# EAGLE schematic ecad-flight-controller-v4-ascend-flight-controllerv4-sch (EAGLE 9.7.0)
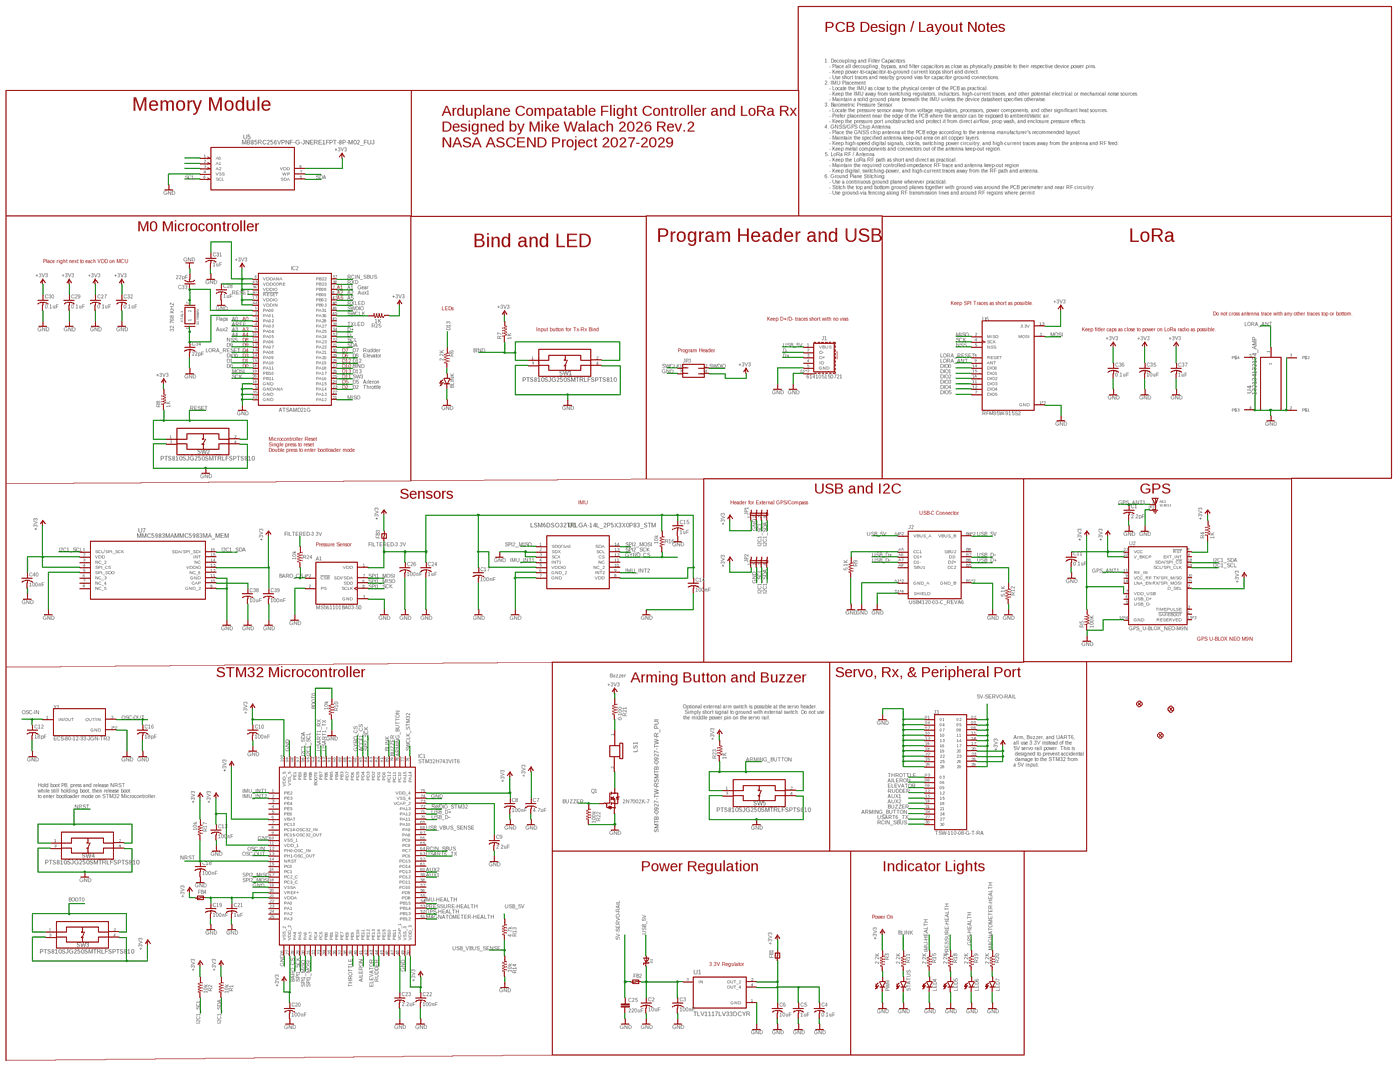
[diagram p0: schematic, sheet 1, overview]
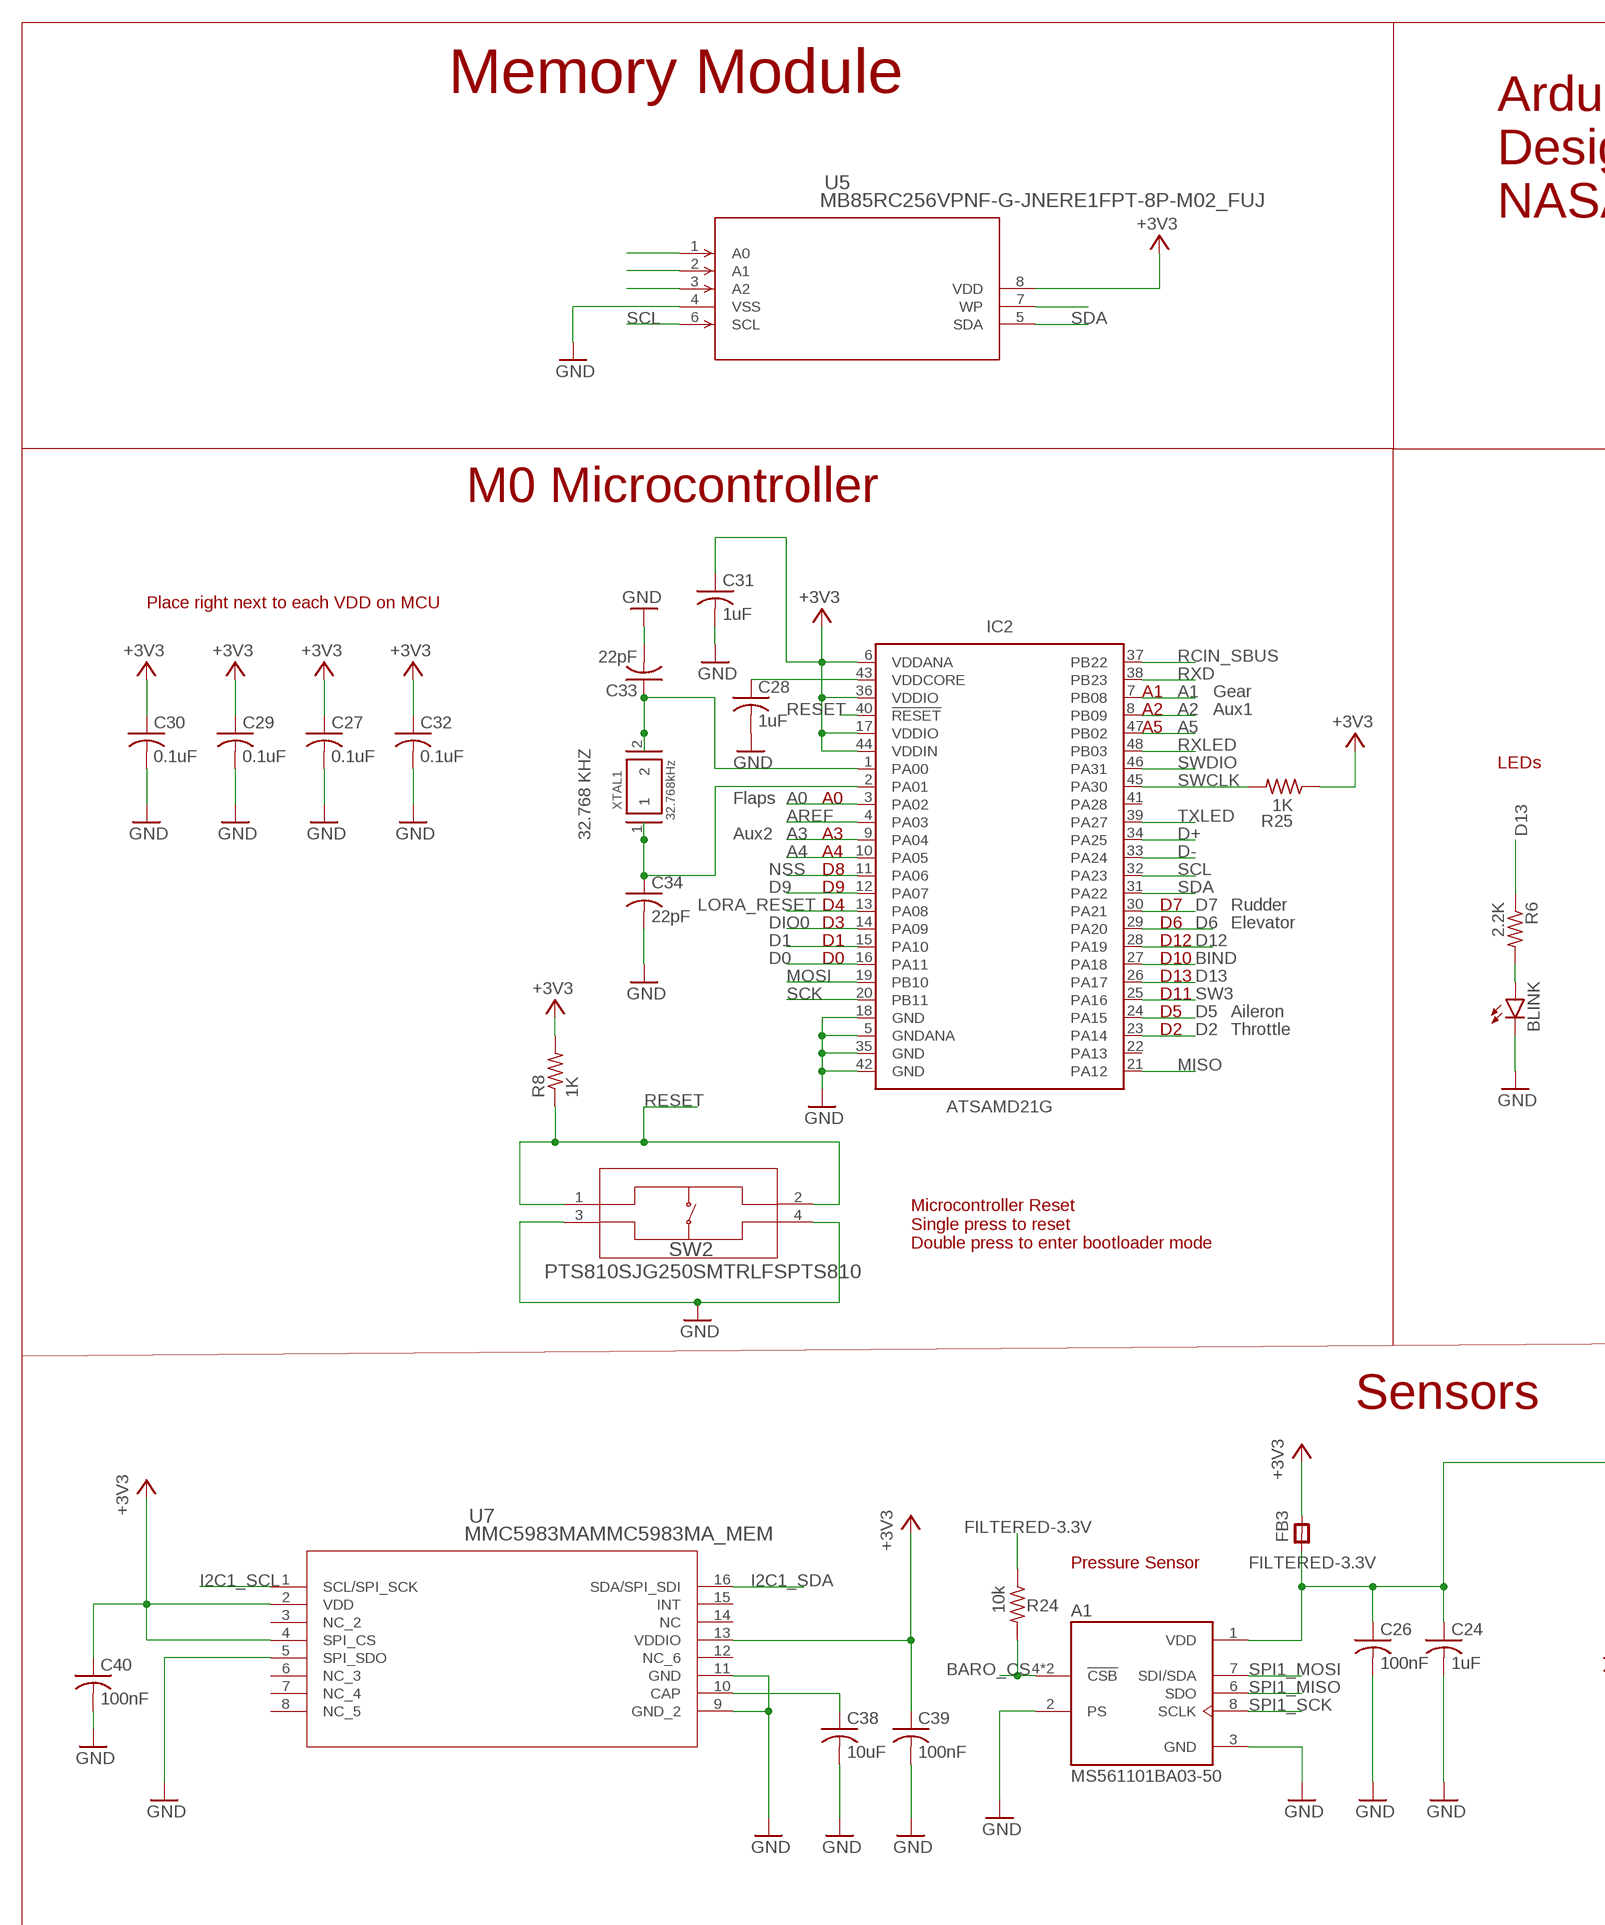
[diagram p1: schematic, sheet 1, part 1 of 4]
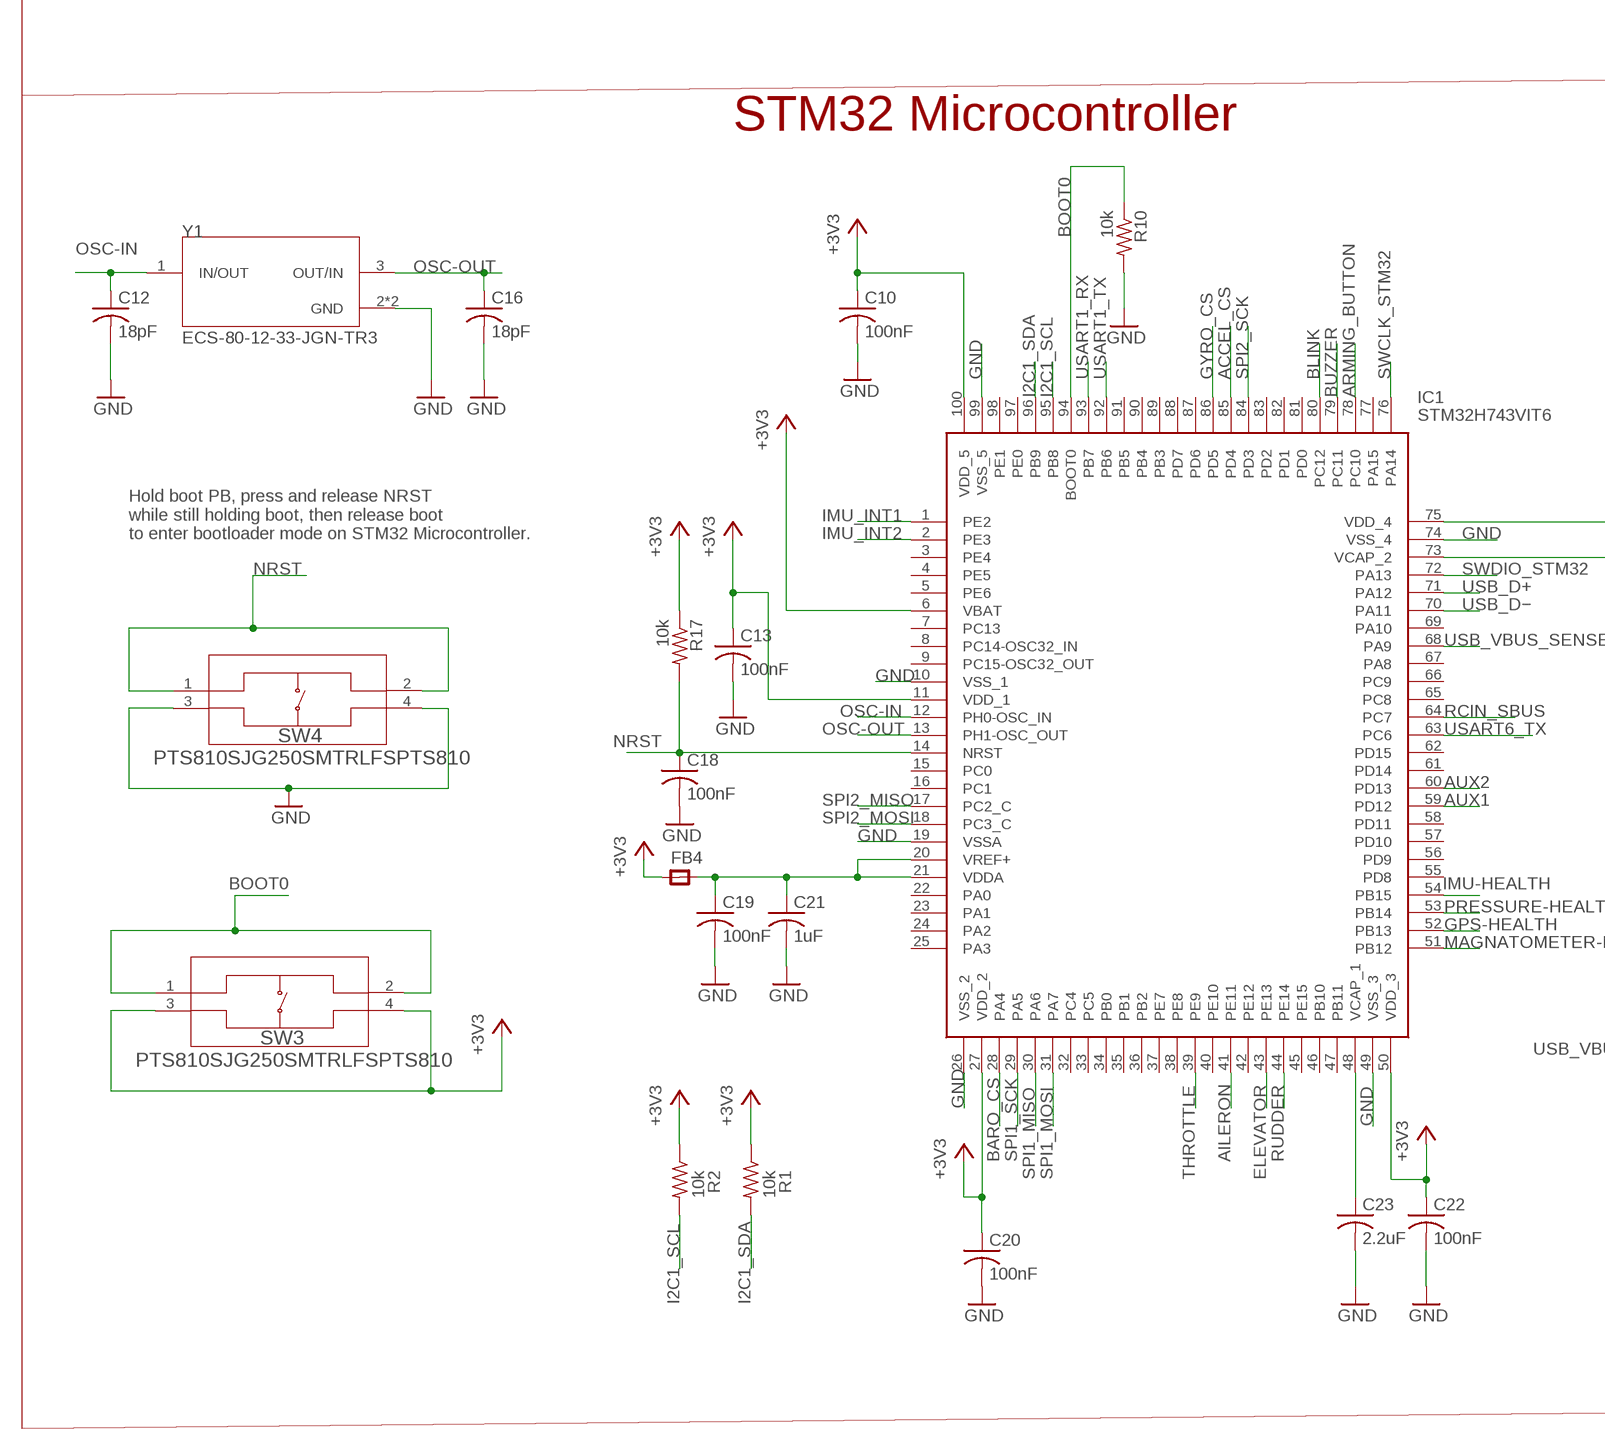
[diagram p2: schematic, sheet 1, part 2 of 4]
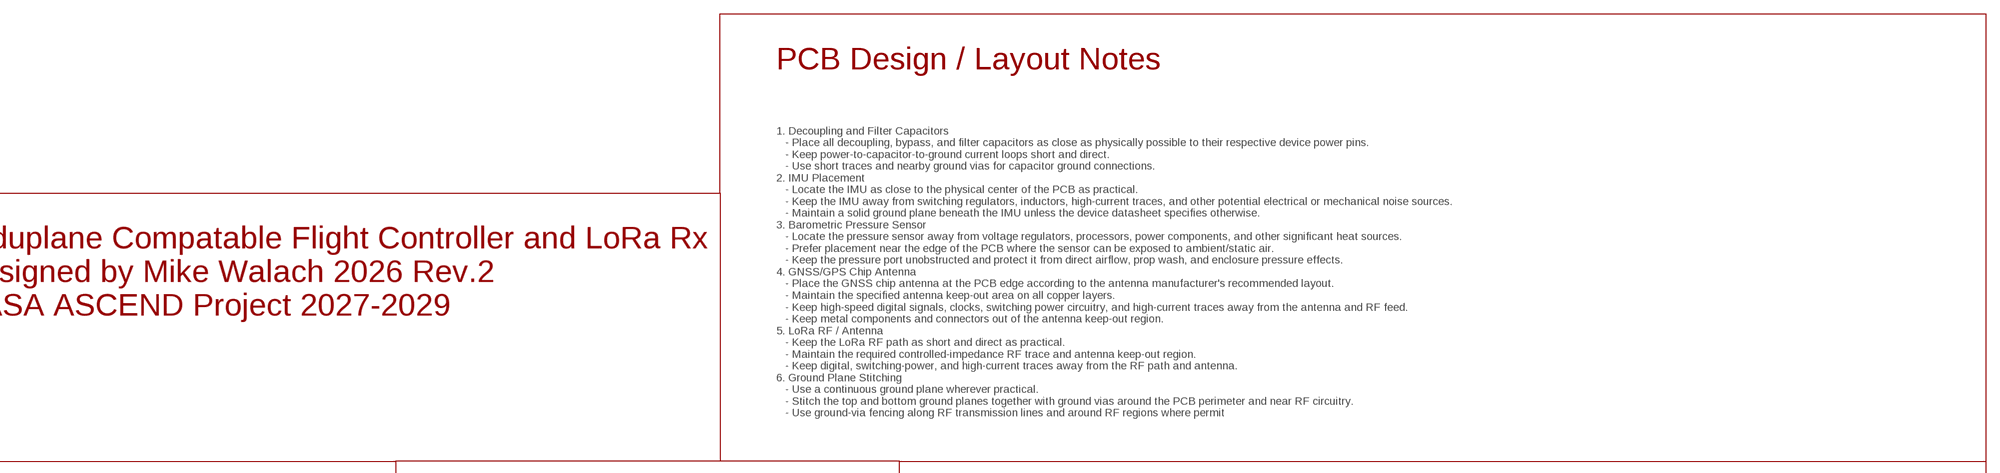
[diagram p3: schematic, sheet 1, part 3 of 4]
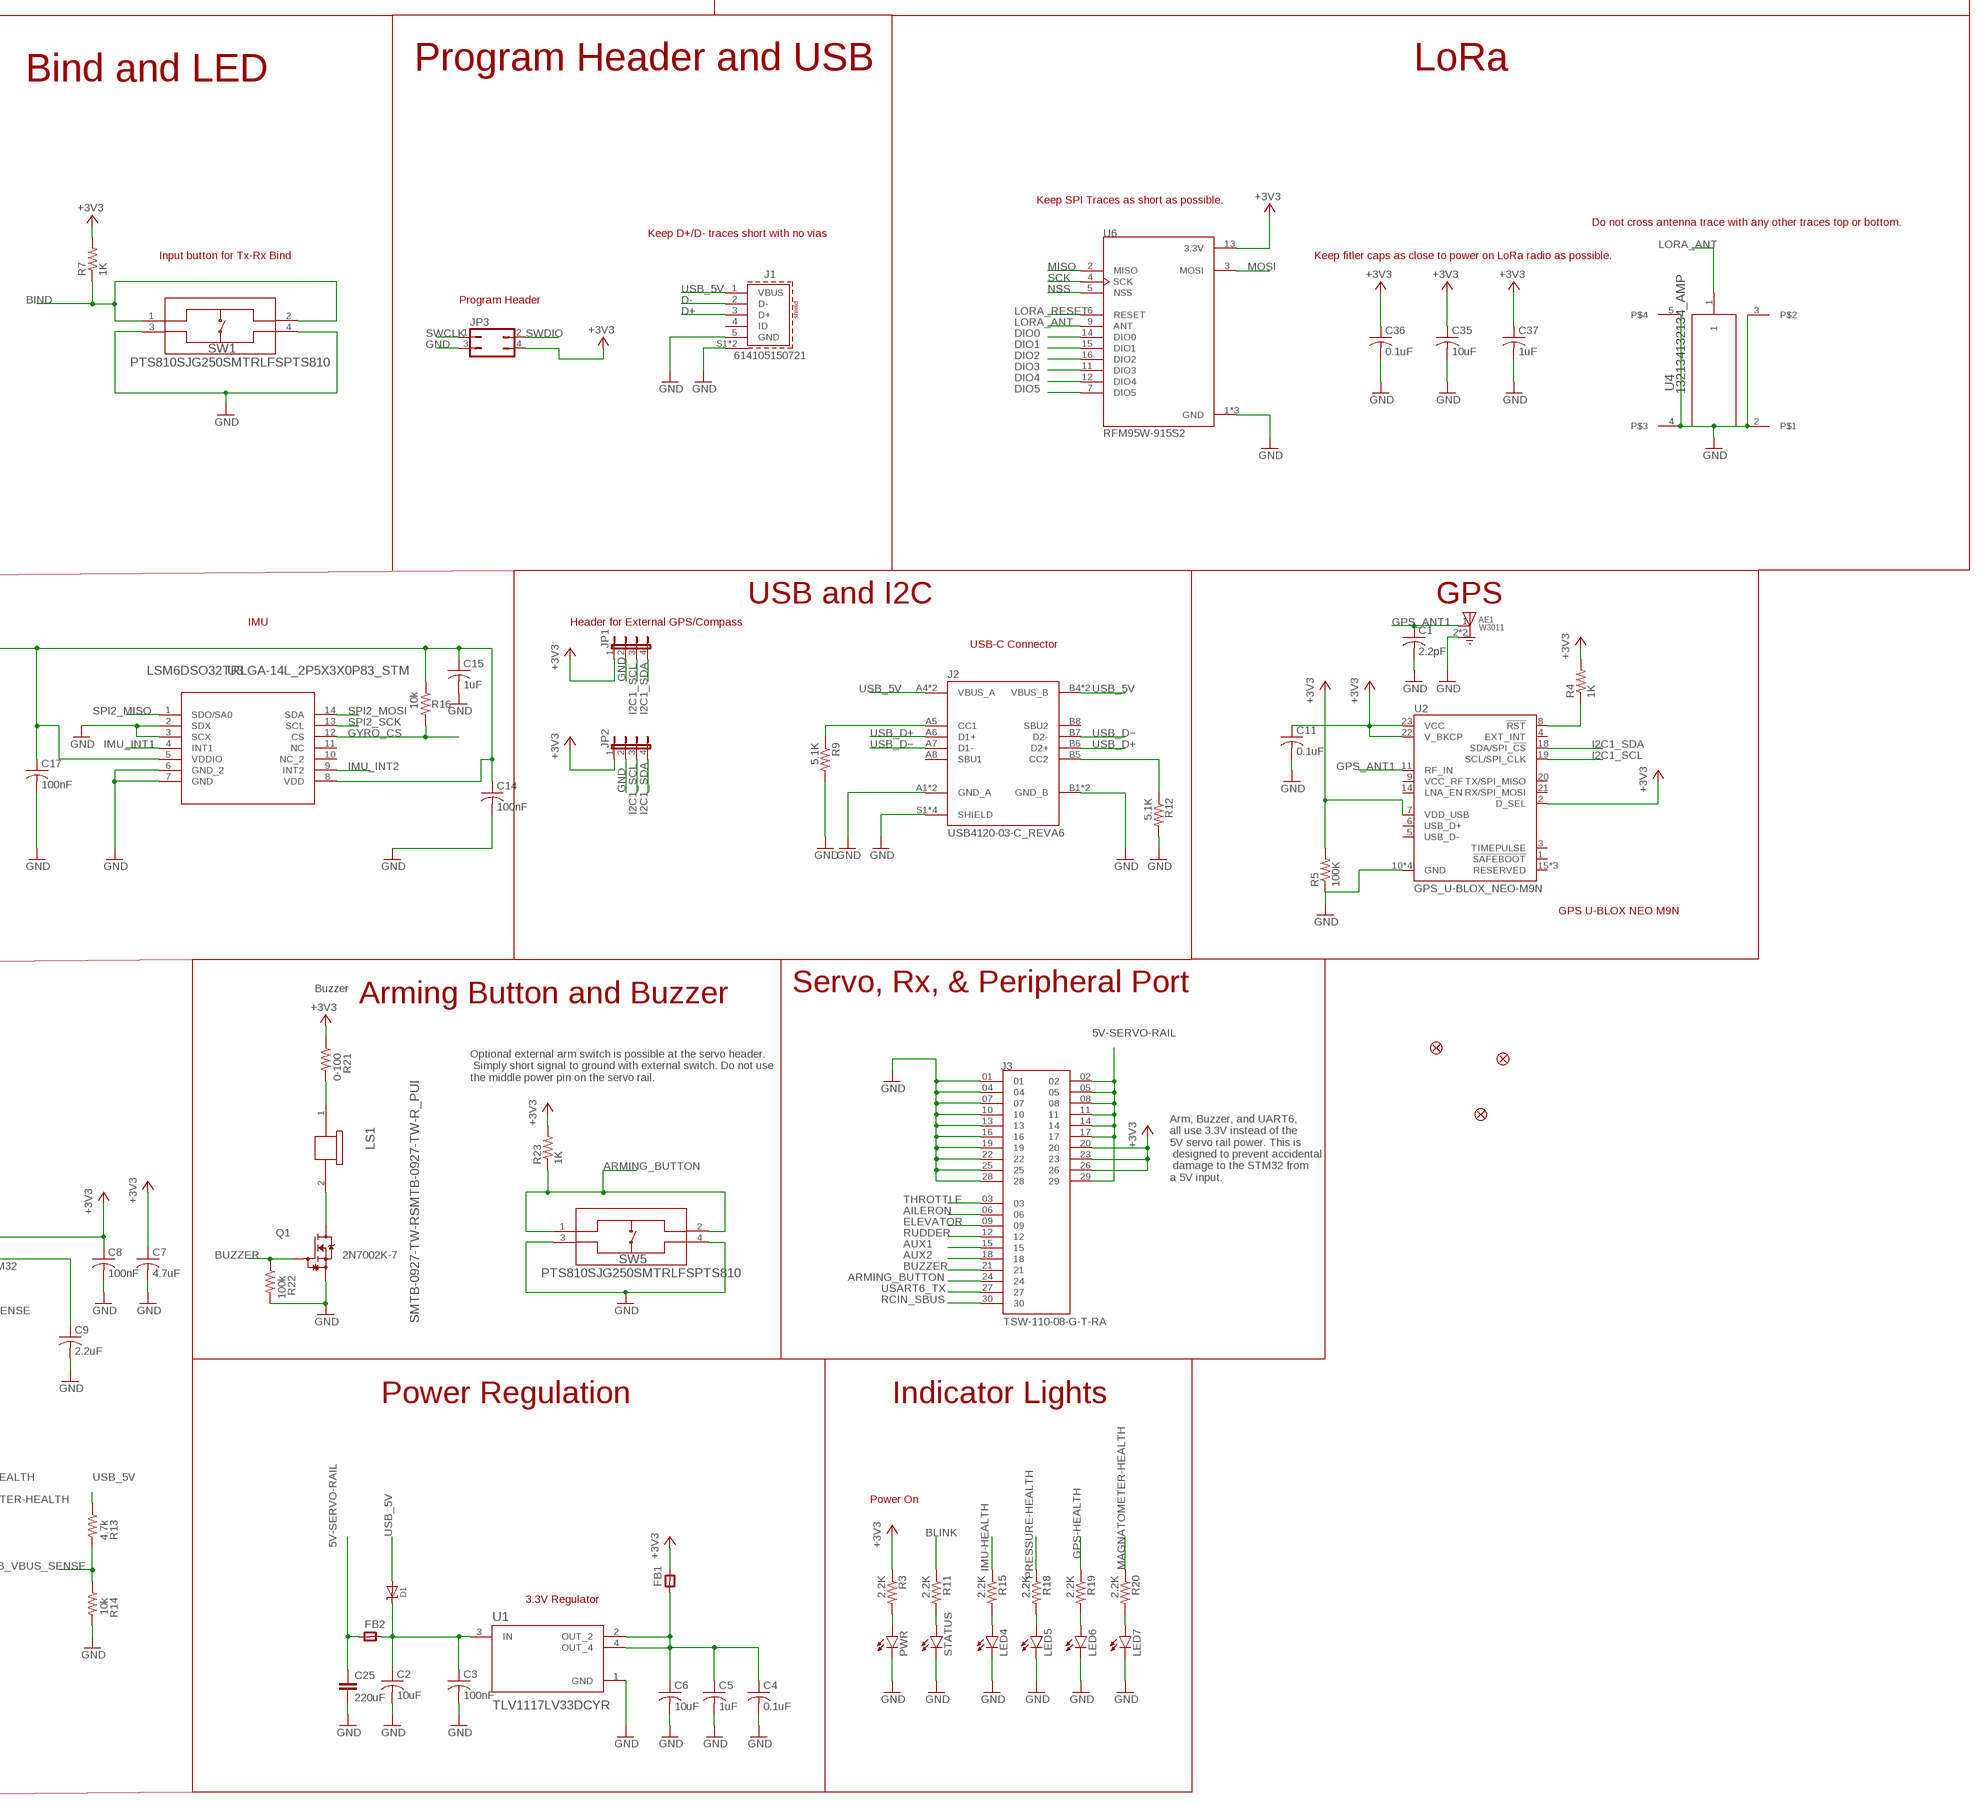
[diagram p4: schematic, sheet 1, part 4 of 4]

## Parts
A1  MS561101BA03-50  [XDCR_MS561101BA03-50]
AE1  W3011  [XDCR_W3011]
BLINK  LEDSML0805  [SML0805]
C1  2.2pF  C-USC0805  [C0805]
C2  10uF  C-USC0805  [C0805]
C3  100nF  C-USC0805  [C0805]
C4  0.1uF  C-USC0805  [C0805]
C5  1uF  C-USC0805  [C0805]
C6  10uF  C-USC0805  [C0805]
C7  4.7uF  C-USC0805  [C0805]
C8  100nF  C-USC0805  [C0805]
C9  2.2uF  C-USC0805  [C0805]
C10  100nF  C-USC0805  [C0805]
C11  0.1uF  C-USC0805  [C0805]
C12  18pF  C-USC0805  [C0805]
C13  100nF  C-USC0805  [C0805]
C14  100nF  C-USC0805  [C0805]
C15  1uF  C-USC0805  [C0805]
C16  18pF  C-USC0805  [C0805]
C17  100nF  C-USC0805  [C0805]
C18  100nF  C-USC0805  [C0805]
C19  100nF  C-USC0805  [C0805]
C20  100nF  C-USC0805  [C0805]
C21  1uF  C-USC0805  [C0805]
C22  100nF  C-USC0805  [C0805]
C23  2.2uF  C-USC0805  [C0805]
C24  1uF  C-USC0805  [C0805]
C25  220uF  1.0UF-1206-50V-10%  [1206]
C26  100nF  C-USC0805  [C0805]
C27  0.1uF  C-USC0805  [C0805]
C28  1uF  C-USC0805  [C0805]
C29  0.1uF  C-USC0805  [C0805]
C30  0.1uF  C-USC0805  [C0805]
C31  1uF  C-USC0805  [C0805]
C32  0.1uF  C-USC0805  [C0805]
C33  22pF  C-USC0805  [C0805]
C34  22pF  C-USC0805  [C0805]
C35  10uF  C-USC0805  [C0805]
C36  0.1uF  C-USC0805  [C0805]
C37  1uF  C-USC0805  [C0805]
C38  10uF  C-USC0805  [C0805]
C39  100nF  C-USC0805  [C0805]
C40  100nF  C-USC0805  [C0805]
D1  MICROBUILDER_DIODE-SCHOTTKYSOD-123  [MICROBUILDER_SOD-123]
FB1  RC-MASTER-SMD_FB_0805MP  [RC-MASTER-SMD_L0805MP]
FB2  RC-MASTER-SMD_FB_0805MP  [RC-MASTER-SMD_L0805MP]
FB3  RC-MASTER-SMD_FB_0805MP  [RC-MASTER-SMD_L0805MP]
FB4  RC-MASTER-SMD_FB_0805MP  [RC-MASTER-SMD_L0805MP]
FID1  FIDUCIAL""  [FIDUCIAL_1MM]
FID2  FIDUCIAL""  [FIDUCIAL_1MM]
FID3  FIDUCIAL""  [FIDUCIAL_1MM]
IC1  STM32H743VIT6  [QFP50P1600X1600X160-100N]
IC2  ATSAMD21G  ATSAMD21G_TQFP  [QFP50P900X900X120-48]
J1  614105150721  [614105150721]
J2  USB4120-03-C_REVA6  [GCT_USB4120-03-C_REVA6]
J3  TSW-110-08-G-T-RA  [SAMTEC_TSW-110-08-G-T-RA]
JP1  1X4_MALE_HEADER  [JUMPER_1_JP4]
JP2  1X4_MALE_HEADER  [JUMPER_1_JP4]
JP3  JP2Q  [JP2Q]
LED4  LEDSML0805  [SML0805]
LED5  LEDSML0805  [SML0805]
LED6  LEDSML0805  [SML0805]
LED7  LEDSML0805  [SML0805]
LS1  SMTB-0927-TW-RSMTB-0927-TW-R_PUI  [SMTB-0927-TW-R_PUI]
PWR  LEDSML0805  [SML0805]
Q1  2N7002K-7  [SOT91P240X110-3N]
R1  10k  R-US_R0805  [R0805]
R2  10k  R-US_R0805  [R0805]
R3  2.2K  R-US_R0805  [R0805]
R4  1K  R-US_R0805  [R0805]
R5  100K  R-US_R0805  [R0805]
R6  2.2K  R-US_R0805  [R0805]
R7  1K  R-US_R0805  [R0805]
R8  1K  R-US_R0805  [R0805]
R9  5.1K  R-US_R0805  [R0805]
R10  10k  R-US_R0805  [R0805]
R11  2.2K  R-US_R0805  [R0805]
R12  5.1K  R-US_R0805  [R0805]
R13  4.7k  R-US_R0805  [R0805]
R14  10k  R-US_R0805  [R0805]
R15  2.2K  R-US_R0805  [R0805]
R16  10k  R-US_R0805  [R0805]
R17  10k  R-US_R0805  [R0805]
R18  2.2K  R-US_R0805  [R0805]
R19  2.2K  R-US_R0805  [R0805]
R20  2.2K  R-US_R0805  [R0805]
R21  0-100  R-US_R0805  [R0805]
R22  100k  R-US_R0805  [R0805]
R23  1K  R-US_R0805  [R0805]
R24  10k  R-US_R0805  [R0805]
R25  1K  R-US_R0805  [R0805]
STATUS  LEDSML0805  [SML0805]
SW1  PTS810SJG250SMTRLFSPTS810  [PTS810]
SW2  PTS810SJG250SMTRLFSPTS810  [PTS810]
SW3  PTS810SJG250SMTRLFSPTS810  [PTS810]
SW4  PTS810SJG250SMTRLFSPTS810  [PTS810]
SW5  PTS810SJG250SMTRLFSPTS810  [PTS810]
U1  TLV1117LV33DCYR  [VREG_TLV1117LV33DCYR]
U2  GPS_U-BLOX_NEO-M9N  [GPS_NEO-M9N]
U3  LSM6DSO32TRLGA-14L_2P5X3X0P83_STM  [LGA-14L_2P5X3X0P83_STM]
U4  132134132134_AMP  [132134_AMP]
U5  MB85RC256VPNF-G-JNERE1FPT-8P-M02_FUJ  [FPT-8P-M02_FUJ]
U6  RFM95W-915S2  [XCVR_RFM95W-915S2]
U7  MMC5983MAMMC5983MA_MEM  [MMC5983MA_MEM]
XTAL1  32.768kHz  ABSO7  [XTAL_ABS07-32.768KHZ-T]
Y1  ECS-80-12-33-JGN-TR3  [XTAL_ECS-240-8-33-AGN-TR]

## Nets
5V-SERVO-RAIL: C25.1 FB2.1 J3.02 J3.05 J3.08 J3.11 J3.14 J3.17 J3.29
+3V3: C7.1 C8.1 C10.1 C11.1 C13.1 C20.1 C22.1 C27.1 C29.1 C30.1 C31.1 C32.1 C35.1 C36.1 C37.1 C39.1 C40.1 FB1.2 FB3.2 FB4.1 IC1.6(VBAT) IC1.11(VDD_1) IC1.27(VDD_2) IC1.50(VDD_3) IC1.75(VDD_4) IC1.100(VDD_5) IC2.6(VDDANA) IC2.17(VDDIO) IC2.36(VDDIO) IC2.44(VDDIN) J3.20 J3.23 J3.26 JP1.1 JP2.1 JP3.4 R1.1 R2.1 R3.1 R4.2 R5.2 R7.2 R8.2 R17.1 R21.1 R23.2 R25.1 SW3.3 SW3.4 U2.2(D_SEL) U2.7(VDD_USB) U2.22(V_BKCP) U2.23(VCC) U5.8(VDD) U6.13(3.3V) U7.2(VDD) U7.4(SPI_CS) U7.13(VDDIO)
A0: IC2.3(PA02)
A1: IC2.7(PB08)
A2: IC2.8(PB09)
A3: IC2.9(PA04)
A4: IC2.10(PA05)
A5: IC2.47(PB02)
ACCEL_CS: IC1.85(PD4)
AILERON: IC1.41(PE11) J3.06
AREF: IC2.4(PA03)
ARMING_BUTTON: IC1.78(PC10) J3.24 R23.1 SW5.1 SW5.2
AUX1: IC1.59(PD12) J3.15
AUX2: IC1.60(PD13) J3.18
BARO_CS: A1.4(!CSB) A1.5(!CSB) IC1.28(PA4) R24.2
BIND: IC2.27(PA18) R7.1 SW1.1 SW1.2
BLINK: IC1.80(PC12) R11.1
BOOT0: IC1.94(BOOT0) R10.1 SW3.1 SW3.2
BUZZER: IC1.79(PC11) J3.21 Q1.1(G) R22.1
D0: IC2.16(PA11)
D1: IC2.15(PA10)
D2: IC2.23(PA14)
D5: IC2.24(PA15)
D6: IC2.29(PA20)
D7: IC2.30(PA21)
D9: IC2.12(PA07)
D12: IC2.28(PA19)
D13: IC2.26(PA17) R6.1
D+: IC2.34(PA25) J1.3(D+)
D-: IC2.33(PA24) J1.2(D-)
DIO0: IC2.14(PA09) U6.14(DIO0)
DIO1: U6.15(DIO1)
DIO2: U6.16(DIO2)
DIO3: U6.11(DIO3)
DIO4: U6.12(DIO4)
DIO5: U6.7(DIO5)
ELEVATOR: IC1.43(PE13) J3.09
FILTERED-3.3V: A1.1(VDD) C14.1 C15.1 C17.1 C24.1 C26.1 FB3.1 R16.1 R24.1 U3.5(VDDIO) U3.8(VDD)
GND: A1.2(PS) A1.3(GND) AE1.2(GND) AE1.3(GND) BLINK.C C1.2 C2.2 C3.2 C4.2 C5.2 C6.2 C7.2 C8.2 C9.2 C10.2 C11.2 C12.2 C13.2 C14.2 C15.2 C16.2 C17.2 C18.2 C19.2 C20.2 C21.2 C22.2 C23.2 C24.2 C25.2 C26.2 C27.2 C28.2 C29.2 C30.2 C31.2 C32.2 C33.2 C34.2 C35.2 C36.2 C37.2 C38.2 C39.2 C40.2 IC1.10(VSS_1) IC1.19(VSSA) IC1.26(VSS_2) IC1.49(VSS_3) IC1.74(VSS_4) IC1.99(VSS_5) IC2.5(GNDANA) IC2.18(GND) IC2.35(GND) IC2.42(GND) J1.5(GND) J1.S1(SHIELD) J1.S2(SHIELD) J2.A1(GND_A) J2.A12(GND_A) J2.B1(GND_B) J2.B12(GND_B) J2.S1(SHIELD) J2.S2(SHIELD) J2.S3(SHIELD) J2.S4(SHIELD) J3.01 J3.04 J3.07 J3.10 J3.13 J3.16 J3.19 J3.22 J3.25 J3.28 JP1.2 JP2.2 JP3.3 LED4.C LED5.C LED6.C LED7.C PWR.C Q1.2(S) R5.1 R9.2 R10.2 R12.2 R14.2 R22.2 STATUS.C SW1.3 SW1.4 SW2.3 SW2.4 SW4.3 SW4.4 SW5.3 SW5.4 U1.1(GND) U2.10(GND) U2.12(GND) U2.13(GND) U2.24(GND) U3.2(SDX) U3.3(SCX) U3.6(GND_2) U3.7(GND) U4.2 U4.3 U4.4 U4.5 U5.4(VSS) U6.1(GND) U6.8(GND) U6.10(GND) U7.5(SPI_SDO) U7.9(GND_2) U7.11(GND) Y1.2(GND) Y1.4(GND)
GPS-HEALTH: IC1.52(PB13) R19.1
GPS_ANT1: AE1.1(FEED) C1.1 U2.11(RF_IN)
GYRO_CS: IC1.86(PD5) R16.2 U3.12(CS)
I2C1_SCL: IC1.95(PB8) JP1.3 JP2.3 R2.2 U2.19(SCL/SPI_CLK) U7.1(SCL/SPI_SCK)
I2C1_SDA: IC1.96(PB9) JP1.4 JP2.4 R1.2 U2.18(SDA/SPI_!CS!) U7.16(SDA/SPI_SDI)
IMU-HEALTH: IC1.54(PB15) R15.1
IMU_INT1: IC1.1(PE2) U3.4(INT1)
IMU_INT2: IC1.2(PE3) U3.9(INT2)
LORA_ANT: U4.1 U6.9(ANT)
LORA_RESET: IC2.13(PA08) U6.6(RESET)
MAGNATOMETER-HEALTH: IC1.51(PB12) R20.1
MISO: IC2.21(PA12) U6.2(MISO)
MOSI: IC2.19(PB10) U6.3(MOSI)
N$1: C9.1 IC1.73(VCAP_2)
N$2: C23.1 IC1.48(VCAP_1)
N$3: C19.1 C21.1 FB4.2 IC1.20(VREF+) IC1.21(VDDA)
N$4: R4.1 U2.8(!RST)
N$5: LS1.1 R21.2
N$6: LS1.2 Q1.3(D)
N$7: LED4.A R15.2
N$8: R11.2 STATUS.A
N$9: C4.1 C5.1 C6.1 FB1.1 U1.2(OUT_2) U1.4(OUT_4)
N$11: C2.1 C3.1 D1.C FB2.2 U1.3(IN)
N$12: LED5.A R18.2
N$13: C28.1 IC2.43(VDDCORE)
N$14: LED6.A R19.2
N$15: LED7.A R20.2
N$16: C34.1 IC2.2(PA01) XTAL1.1
N$17: C33.1 IC2.1(PA00) XTAL1.2
N$19: BLINK.A R6.2
N$20: U5.7(WP)
N$21: U5.3(A2)
N$22: U5.2(A1)
N$23: U5.1(A0)
N$27: C38.1 U7.10(CAP)
N$30: PWR.A R3.2
N$33: J2.A5(CC1) R9.1
N$34: J2.B5(CC2) R12.1
NRST: C18.1 IC1.14(NRST) R17.2 SW4.1 SW4.2
NSS: IC2.11(PA06) U6.5(NSS)
OSC-IN: C12.1 IC1.12(PH0-OSC_IN) Y1.1(IN/OUT)
OSC-OUT: C16.1 IC1.13(PH1-OSC_OUT) Y1.3(OUT/IN)
PRESSURE-HEALTH: IC1.53(PB14) R18.1
RCIN_SBUS: IC1.64(PC7) IC2.37(PB22) J3.30
RESET: IC2.40(!RESET) R8.1 SW2.1 SW2.2
RUDDER: IC1.44(PE14) J3.12
RXD: IC2.38(PB23)
RXLED: IC2.48(PB03)
SCK: IC2.20(PB11) U6.4(SCK)
SCL: IC2.32(PA23) U5.6(SCL)
SDA: IC2.31(PA22) U5.5(SDA)
SPI1_MISO: A1.6(SDO) IC1.30(PA6)
SPI1_MOSI: A1.7(SDI/SDA) IC1.31(PA7)
SPI1_SCK: A1.8(SCLK) IC1.29(PA5)
SPI2_MISO: IC1.17(PC2_C) U3.1(SDO/SA0)
SPI2_MOSI: IC1.18(PC3_C) U3.14(SDA)
SPI2_SCK: IC1.84(PD3) U3.13(SCL)
SW3: IC2.25(PA16)
SWCLK: IC2.45(PA30) JP3.1 R25.2
SWCLK_STM32: IC1.76(PA14)
SWDIO: IC2.46(PA31) JP3.2
SWDIO_STM32: IC1.72(PA13)
THROTTLE: IC1.39(PE9) J3.03
TXLED: IC2.39(PA27)
USART1_RX: IC1.93(PB7)
USART1_TX: IC1.92(PB6)
USART6_TX: IC1.63(PC6) J3.27
USB_5V: D1.A J1.1(VBUS) J2.A4(VBUS_A) J2.A9(VBUS_A) J2.B4(VBUS_B) J2.B9(VBUS_B) R13.1
USB_D+: IC1.71(PA12) J2.A6(D1+) J2.B6(D2+)
USB_D−: IC1.70(PA11) J2.A7(D1-) J2.B7(D2-)
USB_VBUS_SENSE: IC1.68(PA9) R13.2 R14.1
Unconnected: IC1.3(PE4) IC1.4(PE5) IC1.5(PE6) IC1.7(PC13) IC1.8(PC14-OSC32_IN) IC1.9(PC15-OSC32_OUT) IC1.15(PC0) IC1.16(PC1) IC1.22(PA0) IC1.23(PA1) IC1.24(PA2) IC1.25(PA3) IC1.32(PC4) IC1.33(PC5) IC1.34(PB0) IC1.35(PB1) IC1.36(PB2) IC1.37(PE7) IC1.38(PE8) IC1.40(PE10) IC1.42(PE12) IC1.45(PE15) IC1.46(PB10) IC1.47(PB11) IC1.55(PD8) IC1.56(PD9) IC1.57(PD10) IC1.58(PD11) IC1.61(PD14) IC1.62(PD15) IC1.65(PC8) IC1.66(PC9) IC1.67(PA8) IC1.69(PA10) IC1.77(PA15) IC1.81(PD0) IC1.82(PD1) IC1.83(PD2) IC1.87(PD6) IC1.88(PD7) IC1.89(PB3) IC1.90(PB4) IC1.91(PB5) IC1.97(PE0) IC1.98(PE1) IC2.22(PA13) IC2.41(PA28) J1.4(ID) J2.A8(SBU1) J2.B8(SBU2) U2.1(!SAFEBOOT!) U2.3(TIMEPULSE) U2.4(EXT_INT) U2.5(USB_D-) U2.6(USB_D+) U2.9(VCC_RF) U2.14(LNA_EN) U2.15(RESERVED) U2.16(RESERVED) U2.17(RESERVED) U2.20(TX/SPI_MISO) U2.21(RX/SPI_MOSI) U3.10(NC_2) U3.11(NC) U7.3(NC_2) U7.6(NC_3) U7.7(NC_4) U7.8(NC_5) U7.12(NC_6) U7.14(NC) U7.15(INT)

## Notes on the sheet
- PCB Design / Layout Notes
- Memory Module
- Arduplane Compatable Flight Controller and LoRa Rx
- Designed by Mike Walach 2026 Rev.2
- NASA ASCEND Project 2027-2029
- 1. Decoupling and Filter Capacitors
     - Place all decoupling, bypass, and filter capacitors as close as physically possible to their respective device power pins.
     - Keep power-to-capacitor-to-ground current loops short and direct.
     - Use short traces and nearby ground vias for capacitor ground connections.
  2. IMU Placement
     - Locate the IMU as close to the physical center of the PCB as practical.
     - Keep the IMU away from switching regulators, inductors, high-current traces, and other potential electrical or mechanical noise sources.
     - Maintain a solid ground plane beneath the IMU unless the device datasheet specifies otherwise.
  3. Barometric Pressure Sensor
     - Locate the pressure sensor away from voltage regulators, processors, power components, and other significant heat sources.
     - Prefer placement near the edge of the PCB where the sensor can be exposed to ambient/static air.
     - Keep the pressure port unobstructed and protect it from direct airflow, prop wash, and enclosure pressure effects.
  4. GNSS/GPS Chip Antenna
     - Place the GNSS chip antenna at the PCB edge according to the antenna manufacturer's recommended layout.
     - Maintain the specified antenna keep-out area on all copper layers.
     - Keep high-speed digital signals, clocks, switching power circuitry, and high-current traces away from the antenna and RF feed.
     - Keep metal components and connectors out of the antenna keep-out region.
  5. LoRa RF / Antenna
     - Keep the LoRa RF path as short and direct as practical.
     - Maintain the required controlled-impedance RF trace and antenna keep-out region.
     - Keep digital, switching-power, and high-current traces away from the RF path and antenna.
  6. Ground Plane Stitching
     - Use a continuous ground plane wherever practical.
     - Stitch the top and bottom ground planes together with ground vias around the PCB perimeter and near RF circuitry.
     - Use ground-via fencing along RF transmission lines and around RF regions where permitted by the antenna manufacturer's layout recommendations.
     - Do not place ground vias or copper inside GNSS or LoRa antenna keep-out regions.
- M0 Microcontroller
- Bind and LED | Program Header and USB | LoRa
- Place right next to each VDD on MCU
- A1 | Gear
- A2 | Aux1
- A5
- Keep SPI Traces as short as possible.
- LEDs
- Do not cross antenna trace with any other traces top or bottom.
- Flaps | A0 | Keep D+/D- traces short with no vias
- 32.768 KHZ | Aux2 | A3 | Input button for Tx-Rx Bind | Keep fitler caps as close to power on LoRa radio as possible.
- A4
- D8
- D9
- D4 | D7 | Rudder | Program Header
- D3 | D6 | Elevator
- D1 | D12
- D0 | D10
- D13
- D11
- D5 | Aileron
- D2 | Throttle
- Microcontroller Reset
  Single press to reset
  Double press to enter bootloader mode
- USB and I2C | GPS
- Sensors
- IMU | Header for External GPS/Compass
- USB-C Connector
- Pressure Sensor
- GPS U-BLOX NEO M9N
- STM32 Microcontroller | Buzzer | Servo, Rx, & Peripheral Port
- Arming Button and Buzzer
- Optional external arm switch is possible at the servo header.
   Simply short signal to ground with external switch. Do not use 
  the middle power pin on the servo rail.
- Arm, Buzzer, and UART6, 
  all use 3.3V instead of the 
  5V servo rail power. This is
   designed to prevent accidental
   damage to the STM32 from 
  a 5V input.
- Hold boot PB, press and release NRST 
  while still holding boot, then release boot
  to enter bootloader mode on STM32 Microcontroller.
- Power Regulation | Indicator Lights
- Power On
- 3.3V Regulator

## Library data of the parts
A1 = MS561101BA03-50:MS561101BA03-50; MANUFACTURER: TE Connectivity; MAXIMUM_PACKAGE_HEIGHT: 1.1mm; PARTREV: 06/2017; STANDARD: Manufacturer Recommendations
AE1 = W3011:W3011: Antenna Ceramic 3.4dB Gain 1585.42MHz SMD; MANUFACTURER: PulseLarsen; MAXIMUM_PACKAGE_HEIGHT: 1.3 mm; PARTREV: N/A; STANDARD: Manufacturer recommendations
BLINK LED4-LED7 PWR STATUS = led:LED: LED OSRAM: - CHIPLED LG R971, LG N971, LY N971, LG Q971, LY Q971, LO R971, LY R971 LH N974, LH R974 LS Q976, LO Q976, LY Q976 LO Q996 - Hyper CHIPLED LW Q18S LB Q993, LB Q99A, LB R99A - SideLED LS A670, LO A670, LY A670, LG A670, LP A670 LB A673, LV A673, LT A673, LW A673 LH A674 LY A675 LS A676, LA A676, LO A676, LY A676, LW A676 LS A679, LY A679, LG A679 - Hyper Micro SIDELED® LS Y876, LA Y876, LO Y876, LY Y876 LT Y87S - SmartLED LW L88C, LW L88S LB L89C, LB L89S, LG L890 LS L89K, LO L89K, LY L89K LS L896, LA L896, LO L896, LY L896 - TOPLED LS T670, LO T670, LY T670, LG T670, LP T670 LSG T670, LSP T670, LSY T670, LOP T670, LYG T670 LG T671, LOG T671, LSG T671 LB T673, LV T673, LT T673, LW T673 LH T674 LS T676, LA T676, LO T676, LY T676, LB T676, LH T676, LSB T676, LW T676 LB T67C, LV T67C, LT T67C, LS T67K, LO T67K, LY T67K, LW E67C LS E67B, LA E67B, LO E67B, LY E67B, LB E67C, LV E67C, LT E67C LW T67C LS T679, LY T679, LG T679 LS T770, LO T770, LY T770, LG T770, LP T770 LB T773, LV T773, LT T773, LW T773 LH T774 LS E675, LA E675, LY E675, LS T675 LS T776, LA T776, LO T776, LY T776, LB T776 LHGB T686 LT T68C, LB T68C - Hyper Mini TOPLED® LB M676 - Mini TOPLED Santana® LG M470 LS M47K, LO M47K, LY M47K Source: http://www.osram.convergy.de LUXEON: - LUMILED® LXK2-PW12-R00, LXK2-PW12-S00, LXK2-PW14-U00, LXK2-PW14-V00 LXK2-PM12-R00, LXK2-PM12-S00, LXK2-PM14-U00 LXK2-PE12-Q00, LXK2-PE12-R00, LXK2-PE12-S00, LXK2-PE14-T00, LXK2-PE14-U00 LXK2-PB12-K00, LXK2-PB12-L00, LXK2-PB12-M00, LXK2-PB14-N00, LXK2-PB14-P00, LXK2-PB14-Q00 LXK2-PR12-L00, LXK2-PR12-M00, LXK2-PR14-Q00, LXK2-PR14-R00 LXK2-PD12-Q00, LXK2-PD12-R00, LXK2-PD12-S00 LXK2-PH12-R00, LXK2-PH12-S00 LXK2-PL12-P00, LXK2-PL12-Q00, LXK2-PL12-R00 Source: www.luxeon.com KINGBRIGHT: KA-3528ASYC Source: www.kingbright.com
C1-C24 C26-C40 = rcl:C-US: CAPACITOR, American symbol; SPICEPREFIX: C
C25 = SparkFun-Capacitors:1.0UF: 1µF ceramic capacitors A capacitor is a passive two-terminal electrical component used to store electrical energy temporarily in an electric field.; PROD_ID: CAP-09822; VALUE: 1.0uF
D1 = flightcomputer-2023:MICROBUILDER_DIODE-SCHOTTKY
FB1-FB4 = 52101-101-REV-A_v16:RC-MASTER-SMD_FB_: FERRITE BEAD
FID1-FID3 = Airquality_Sensor:FIDUCIAL: Fiducial Alignment Points Various fiducial points for machine vision alignment.; BOM: EXCLUDE
IC1 = STM32H743VIT6:STM32H743VIT6: ARM Microcontrollers - MCU High-performance and DSP with DP-FPU, ARM Cortex-M7 MCU with 2MBytes Flash, 1MB RAM, 400 MHz CPU, Art Accelerator, L1 cache, external memory interface, large set of peripherals Source: Datasheet <https://www.st.com/resource/en/datasheet/stm32h743vi.pdf>; DESCRIPTION: ARM Microcontrollers - MCU High-performance and DSP with DP-FPU, ARM Cortex-M7 MCU with 2MBytes Flash, 1MB RAM, 400 MHz CPU, Art Accelerator, L1 cache, external memory interface, large set of peripherals; HEIGHT: 1.6mm; MANUFACTURER_NAME: STMicroelectronics; MANUFACTURER_PART_NUMBER: STM32H743VIT6; MOUSER_PART_NUMBER: 511-STM32H743VIT6; MOUSER_PRICE-STOCK: https://www.mouser.co.uk/ProductDetail/STMicroelectronics/STM32H743VIT6?qs=FNcb6ahWXRw0Me5k2ZHgWw%3D%3D
IC2 = IC_Embedded:ATSAMD21G*: 32-bit ARM-Based Microcontrollers Datasheet <http://ww1.microchip.com/downloads/en/devicedoc/40001884a.pdf> Note:For this part User needs to add thermal via in thermal pad in QFN package while designing a board.; CATEGORY: IC_Embedded; CORE: ARM Cortex M0+; DESCRIPTION: Low-power, high-performance Microchip's ARM® Cortex®-M0+ based flash microcontroller; MANUFACTURER: Microchip Technology; MPN: ATSAMD21G; OPERATING_TEMP: variable; PACKAGE: TQFP-48; PART_STATUS: Active; ROHS_COMPLIANT: COMPLIANT; SERIES: SAM D21G; SUB-CATEGORY: Microcontroller; TYPE: 32 bit Microcontroller
J1 = 614105150721:614105150721
J2 = USB4120-03-C_REVA6:USB4120-03-C_REVA6; MANUFACTURER: Global Connector Technology; MAXIMUM_PACKAGE_HEIGHT: 6.5mm; PARTREV: A6; SNAPEDA_PN: USB4120-03-C; STANDARD: Manufacturer Recommendations
J3 = TSW-110-08-G-T-RA:TSW-110-08-G-T-RA; MANUFACTURER: Samtec; PARTREV: R; STANDARD: Manufacturer Recommendations
JP1 JP2 = BOBCAT_Library:1X4_MALE_HEADER: JUMPER
JP3 = jumper:JP2Q: JUMPER
LS1 = 2026-06-20_23-40-30_Library:SMTB-0927-TW-R; COPYRIGHT: Copyright (C) 2026 Ultra Librarian. All rights reserved.; MANUFACTURER_NAME: PUI Audio; MANUFACTURER_PART_NUMBER: SMTB-0927-TW-R
Q1 = 2N7002K-7:2N7002K-7: 2N7002K Series 60 V 2 Ohm SMT N-Channel Enhancement Mode Mosfet - SOT-23-3; MANUFACTURER: Diodes Inc.; MAXIMUM_PACKAGE_HIEGHT: 1.1mm; PARTREV: 15-2; STANDARD: IPC7351B
R1-R25 = rcl:R-US_: RESISTOR, American symbol; SPICEPREFIX: R
SW1-SW5 = 2024-06-17_17-27-14_Library:PTS810SJG250SMTRLFS; COPYRIGHT: Copyright (C) 2024 Ultra Librarian. All rights reserved.; MANUFACTURER_PART_NUMBER: PTS810SJG250SMTRLFS; MFR_NAME: C&K Components
U1 = TLV1117LV33DCYR:TLV1117LV33DCYR; MANUFACTURER: Texas Instruments; MAXIMUM_PACKAGE_HEIGHT: 1.80 mm; PARTREV: B; STANDARD: IPC-7351B
U2 = SparkFun GPS NEO_M9N_ANT:GPS_U-BLOX_NEO-M9N: u-blox NEO-M9N GPS Module The NEO-M9N module is built on the robust u-blox M9 GNSS chip, which provides exceptional sensitivity and acquisition times for all L1 GNSS systems. The u-blox M9 standard precision GNSS platform, which delivers meter-level accuracy, succeeds the well-known u-blox M8 product range. The receiver also provides higher navigation rate and improved security features compared to previous u-blox GNSS generations. The NEO-M9N module is available in the NEO form factor LLC package; PROD_ID: IC-14651
U3 = LSM6DSO32TR_extendedpads_fixed_v2:LSM6DSO32TR; COPYRIGHT: Copyright (C) 2026 Ultra Librarian. All rights reserved.; DATASHEET: https://www.st.com/resource/en/datasheet/lsm6dso32.pdf; DESCRIPTION: 6-axis IMU (inertial measurement unit): 3-axis accelerometer and 3-axis gyroscope; MANUFACTURER_NAME: STMicroelectronics; MANUFACTURER_PART_NUMBER: LSM6DSO32TR
U4 = 2025-03-19_02-22-58_Library:132134; COPYRIGHT: Copyright (C) 2025 Ultra Librarian. All rights reserved.; MANUFACTURER_PART_NUMBER: 132134; MFR_NAME: Amphenol ICC
U5 = 2025-09-02_13-41-18_Library:MB85RC256VPNF-G-JNERE1; COPYRIGHT: Copyright (C) 2025 Ultra Librarian. All rights reserved.; MANUFACTURER_NAME: Fujitsu Semiconductor; MANUFACTURER_PART_NUMBER: MB85RC256VPNF-G-JNERE1
U6 = RFM95W-915S2:RFM95W-915S2: Check availability <https://pricing.snapeda.com/parts/RFM95W-915S2/RF%20Solutions/view-part?ref=eda>; AVAILABILITY: In Stock; CHECK_PRICES: https://www.snapeda.com/parts/RFM95W-915S2/RF/view-part/?ref=eda; DESCRIPTION: 802.15.4 LoRa™ Transceiver Module 915MHz Antenna Not Included Surface Mount; MF: RF Solutions; MP: RFM95W-915S2; PACKAGE: Non Standard RF Solutions; PRICE: None; PURCHASE-URL: https://www.snapeda.com/api/url_track_click_mouser/?unipart_id=585488&manufacturer=RF Solutions&part_name=RFM95W-915S2&search_term=None; SNAPEDA_LINK: https://www.snapeda.com/parts/RFM95W-915S2/RF/view-part/?ref=snap
U7 = MMC5983MA_SAME_SYMBOL_HANDSOLDER:MMC5983MA; COPYRIGHT: Copyright (C) 2026 Ultra Librarian. All rights reserved.; MANUFACTURER_NAME: Memsic; MANUFACTURER_PART_NUMBER: MMC5983MA
XTAL1 = Crystal-WA:ABSO7: CRYSTAL 32.7680KHZ 12.5PF SMD Datasheet <https://abracon.com/Resonators/ABS07.pdf>; CATEGORY: Crystal; MANUFACTURER: Abracon LLC; MPN: ABS07-32.768KHZ-T; OPERATING_TEMPERATURE: -40°C ~ 85°C; PART_STATUS: ACTIVE; ROHS_COMPLIANT: COMPLIANT; SERIES: ABS07; SUB_CATEGORY: Crystal Surface Mount; TYPE: Crystal
Y1 = ECS-80-12-33-JGN-TR3:ECS-80-12-33-JGN-TR3; AVAILABILITY: Good; DESCRIPTION: The sub miniature ECX-32 is a compact SMD Crystal.; MF: ECS INC; MP: ECX-32; PACKAGE: SMD-4 ECX; STANDARD: Manufacturer recommendations